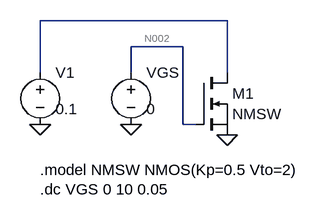
[diagram p0: schematic Ex11.asc]
Ex11.asc, the LTspice schematic file:
Version 4
SHEET 1 880 680
WIRE 80 200 80 120
WIRE 80 120 368 120
WIRE 368 120 368 200
WIRE 220 200 220 160
WIRE 220 160 300 160
WIRE 300 160 300 280
WIRE 300 280 320 280
FLAG 80 280 0
FLAG 220 280 0
FLAG 368 296 0
SYMBOL voltage 80 184 R0
WINDOW 0 24 16 Left 2
WINDOW 3 24 72 Left 2
SYMATTR InstName V1
SYMATTR Value 0.1
SYMBOL voltage 220 184 R0
WINDOW 0 24 16 Left 2
WINDOW 3 24 72 Left 2
SYMATTR InstName VGS
SYMATTR Value 0
SYMBOL nmos 320 200 R0
WINDOW 0 56 32 Left 2
WINDOW 3 56 64 Left 2
SYMATTR InstName M1
SYMATTR Value NMSW
TEXT 80 350 Left 2 !.model NMSW NMOS(Kp=0.5 Vto=2)
TEXT 80 380 Left 2 !.dc VGS 0 10 0.05

The netlist it stands for:
* Ex11.asc
V1 N001 0 0.1
VGS N002 0 0
M1 N001 N002 0 0 NMSW
.model NMOS NMOS
.model PMOS PMOS
.lib standard.mos
.model NMSW NMOS(Kp=0.5 Vto=2)
.dc VGS 0 10 0.05
.backanno
.end

* Results of the author's LTspice run, read from the files saved beside the schematic
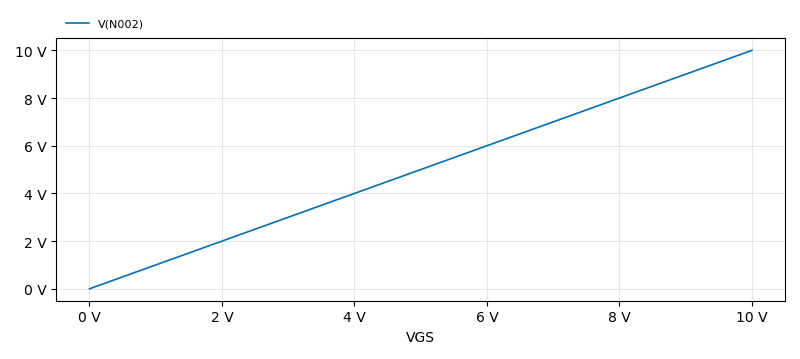
[diagram p1: DC transfer characteristic of Ex11.asc, plotted from the saved traces]
* DC transfer characteristic, 1 run:
*   V(N002): 0 V at VGS=0 V, 10 V at VGS=10 V, min 0 V, max 10 V